# Altium schematic sheet Laser Driver.SchDoc
size A4; DrawnBy: AS; Revision: 1.0; SheetNumber: 2; SheetTotal: 1; Prg: Quantum Key Distribution; PrJ: Laser Driver; PN: QKD-LD-002; LastMod: Oct. 27, 2026
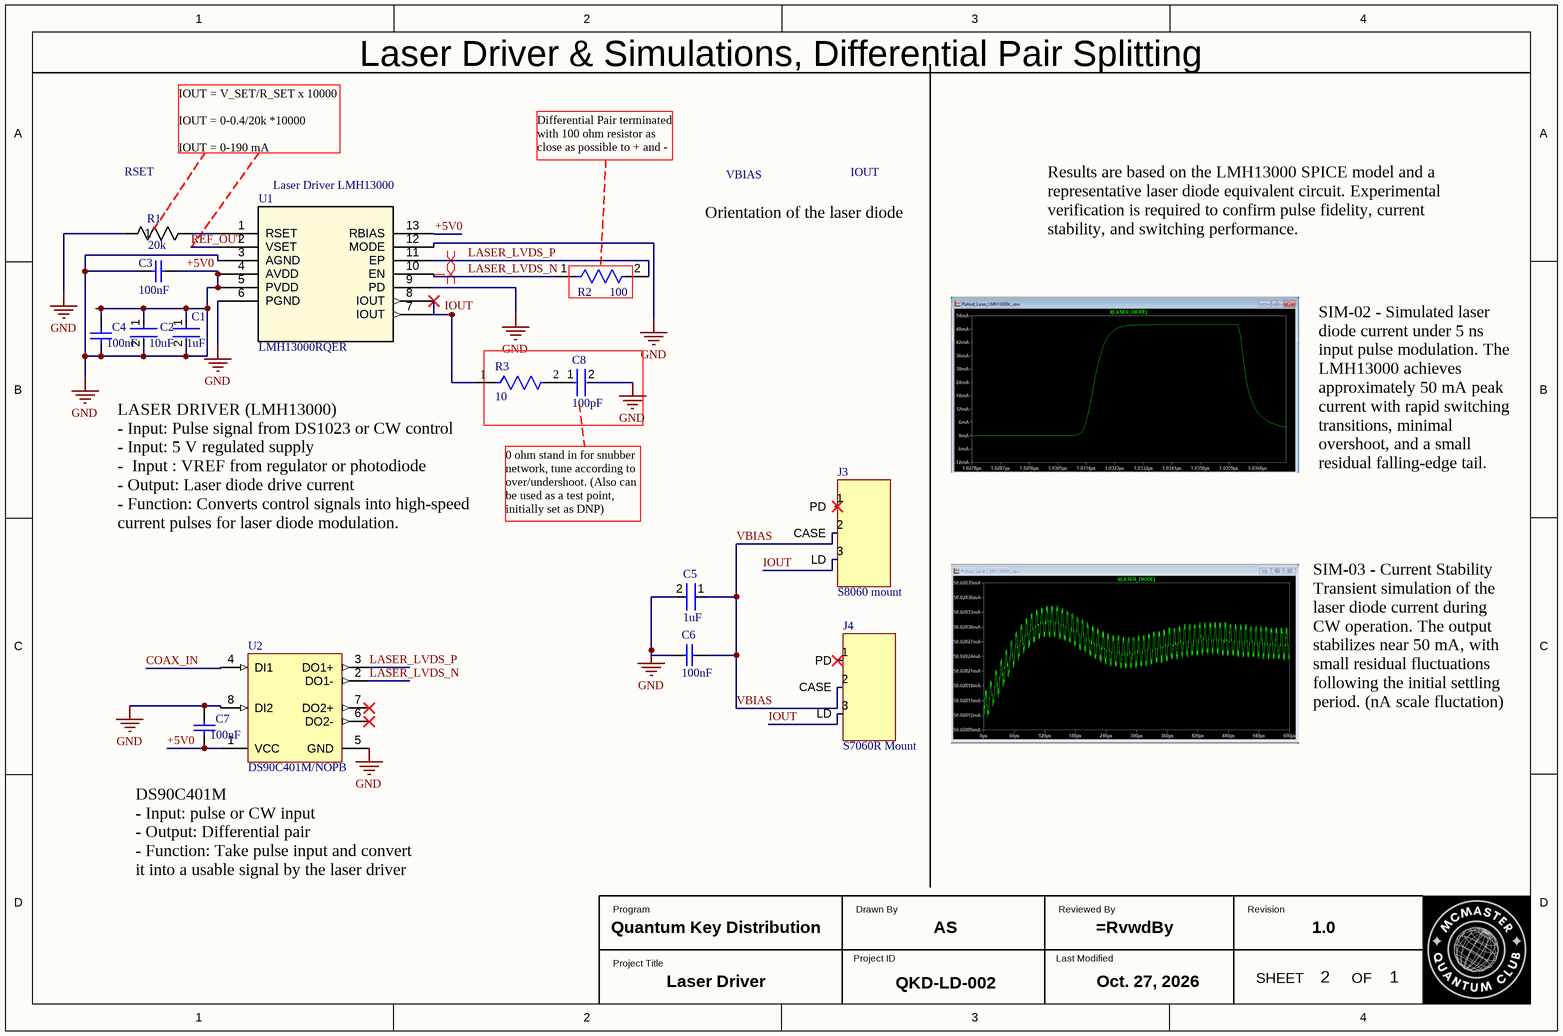
[diagram p0: Laser Driver.SchDoc]

## Parts
C1  1uF  [FP-1206-L_3_2_0_15-W_1_6-IPC_A]
C2  10uF  [FP-GCJ31C-0_4-IPC_C]
C3  100nF  [CAPC2013X145X50LL20T20]
C4  100nF  [CAPC2013X145X50LL20T20]
C5  1uF  [FP-1206-L_3_2_0_15-W_1_6-IPC_A]
C6  100nF  [CAPC2013X145X50LL20T20]
C7  100nF  [CAPC2013X145X50LL20T20]
C8  100pF  [FP-KCA55L-6_1_5_1_3_0_9-C-MFG]
J3  S8060 mount  [PCBComponent_1]
J4  S7060R Mount  [PCBComponent_1]
R1  20k  [MCA 1206_VIS]
R2  100  [FP-MCS0402-IPC_B]
R3  10  [FP-TFCR0603-IPC_B]
U1  LMH13000RQER  [XLMH13000RQER.A_WQFN-HR_TXI_TEX]
U2  DS90C401M/NOPB  [D0008A_N]

## Nets
+5V0: C1.1 C1.2 C2.1 C2.2 C3.1 C3.2 C4.1 C4.2 C5.2 C6.1 C7.1 C7.2 C8.2 R1.1 U1.3(AGND) U1.4(AVDD) U1.5(PVDD) U1.6(PGND) U1.9(PD) U1.12(MODE) U1.13(RBIAS) U2.1(VCC) U2.5(GND) U2.8(DI2)  [also labelled GND]
\: R2.1 U1.10(EN) U2.2(DO1-)  [also labelled LASER_LVDS_N]
COAX_IN: U2.4(DI1)
IOUT: J3.3(LD) J4.3(LD)
LASER_LVDS_P: R2.2 U1.11(EP) U2.3(DO1+)
REF_OUT: U1.2(VSET)
VBIAS: C5.1 C6.2 J3.2(CASE) J4.2(CASE)
NetC8_1: C8.1 R3.2
NetR1_2: R1.2 U1.1(RSET)
NetR3_1: R3.1 U1.7(IOUT)

Not connected (* = marked no-connect by the designer): J3 1(PD)*; J4 1(PD)*; U1 8(IOUT)*; U2 6(DO2-)* 7(DO2+)*

## Layout directives
differential pair: \, LASER_LVDS_P

## Notes on the sheet
- Laser Driver & Simulations, Differential Pair Splitting
- RSET
- IOUT = V_SET/R_SET x 10000
  IOUT = 0-0.4/20k *10000
  IOUT = 0-190 mA
- Differential Pair terminated with 100 ohm resistor as close as possible to + and -
- VBIAS
- IOUT
- (near U1) Laser Driver LMH13000
- Orientation of the laser diode
- Results are based on the LMH13000 SPICE model and a representative laser diode equivalent circuit. Experimental verification is required to confirm pulse fidelity, current stability, and switching performance.
- 0 ohm stand in for snubber network, tune according to over/undershoot. (Also can be used as a test point, initially set as DNP)
- SIM-02 - Simulated laser diode current under 5 ns input pulse modulation. The LMH13000 achieves approximately 50 mA peak current with rapid switching transitions, minimal overshoot, and a small residual falling-edge tail.
- (near R3) LASER DRIVER (LMH13000)
  - Input: Pulse signal from DS1023 or CW control
  - Input: 5 V regulated supply
  -  Input : VREF from regulator or photodiode
  - Output: Laser diode drive current
  - Function: Converts control signals into high-speed current pulses for laser diode modulation.
- Type @ to refer to a designator
- SIM-03 - Current Stability
  Transient simulation of the laser diode current during CW operation. The output stabilizes near 50 mA, with small residual fluctuations following the initial settling period. (nA scale fluctation)
- DS90C401M
  - Input: pulse or CW input
  - Output: Differential pair
  - Function: Take pulse input and convert it into a usable signal by the laser driver
- Labels drawn without touching a wire or pin: IOUT
- Program
- Drawn By
- Reviewed By
- Revision
- Project Title
- Project ID
- Last Modified
- SHEET
- OF

## Library data of the parts
C1 C5 = CMP-14477-003123-2: None
C2 = CMP-06035-004889-1: Cap Ceramic 10uF 35V X7T 10% SMD 1206 +125°C Embossed Plastic T/R
C3 C4 C6 C7 = CMP-2007-01396-1: Part Number: VJ0805Y104JXXPW1BC; Manufacturer: Vitramon
C8 = CMP-06035-061656-1: Metal Terminal Type Multilayer Ceramic Capacitors 100pF ±10% 250Vac(r.m.s.) U2J -750±120ppm/℃ AEC-Q200 SMD2
J3 J4 = Component_1
R1 = CMP-00030-44469054-1: MCA12060D2002BP500 SMD Chip Resistor, 20 kOhm, ± 0.1%, 250 mW, 1206 [3216 Metric], Thin Film, Precision; Resistance: 20kΩ; Temperature Coefficient: 25ppm/°C; Power Rating: 250mW; Voltage Rating: 200V; RoHS: Compliant; NexarPartId: 44469054; Lead Free: Lead Free; Composition: Thin Film; Tolerance: 0.1%; Min Operating Temperature: -55°C; Max Operating Temperature: 125°C; Depth: 1.6mm; Packaging: Tape and Reel; Military Standard: Not; Height: 650µm; Width: 1.6mm; Case/Package: 1206; Length: 3.2mm
R2 = CMP-02407-000612-1: RES SMD 1.2K OHM 1% 1/10W 0402; Resistance: 100R; Tolerance: 0.1%; Power Rating: 63mW; Temperature Coefficient: 25ppm/°C; Voltage Rating: 50V; Length: 1mm; Width: 0.5mm; Min Operating Temperature: -55°C; Height: 0.32mm; Composition: Thin Film; Case/Package: 0402; Case Code (Imperial): 0402; Packaging: Tape and Reel; Weight: 2.1E-05oz; Case Code (Metric): 1005; Max Operating Temperature: 155°C; Termination: SMD/SMT; Contact Plating: Tin
R3 = CMP-250906-269177-1: RES Thin Film,  10Ω, 0.5%, 0.1W, 50ppm/°C, 0603
U1 = LMH13000RQER: High-speed, voltage-controlled current output driver 13-WQFN-HR -40 to 125; Manufacturer_Name: Texas Instruments; Copyright: Copyright (C) 2025 Ultra Librarian. All rights reserved.; Manufacturer_Part_Number: LMH13000RQER; RefDes: RefDes; Type: Type
U2 = CMP-0058-00916-3: Dual Low Voltage Differential Signaling (LVDS) Driver, 8 pin SOIC NARROW; Manufacturer: Texas Instruments; CompType: Interface IC; PowerWise: N; PackageTopMarking: NSZXTT*DS90C*401M; RoHS: Y; PackageReference: D0008A; PackageDescription: SOIC Narrow, 4.9 x 3.9 x 1.45mm, 8 Lead, 1.27mm Pitch; ComponentLink1Description: Datasheet URL; Code_IPC: SOIC127P600-8; ComponentLink1URL: http://www.ti.com/general/docs/lit/getliterature.tsp?genericPartNumber=DS90C401&fileType=pdf; Code_JEDEC: MS-012-AA; PinCount: 8